# Altium project invernadero (atmega y nano).PrjPcb
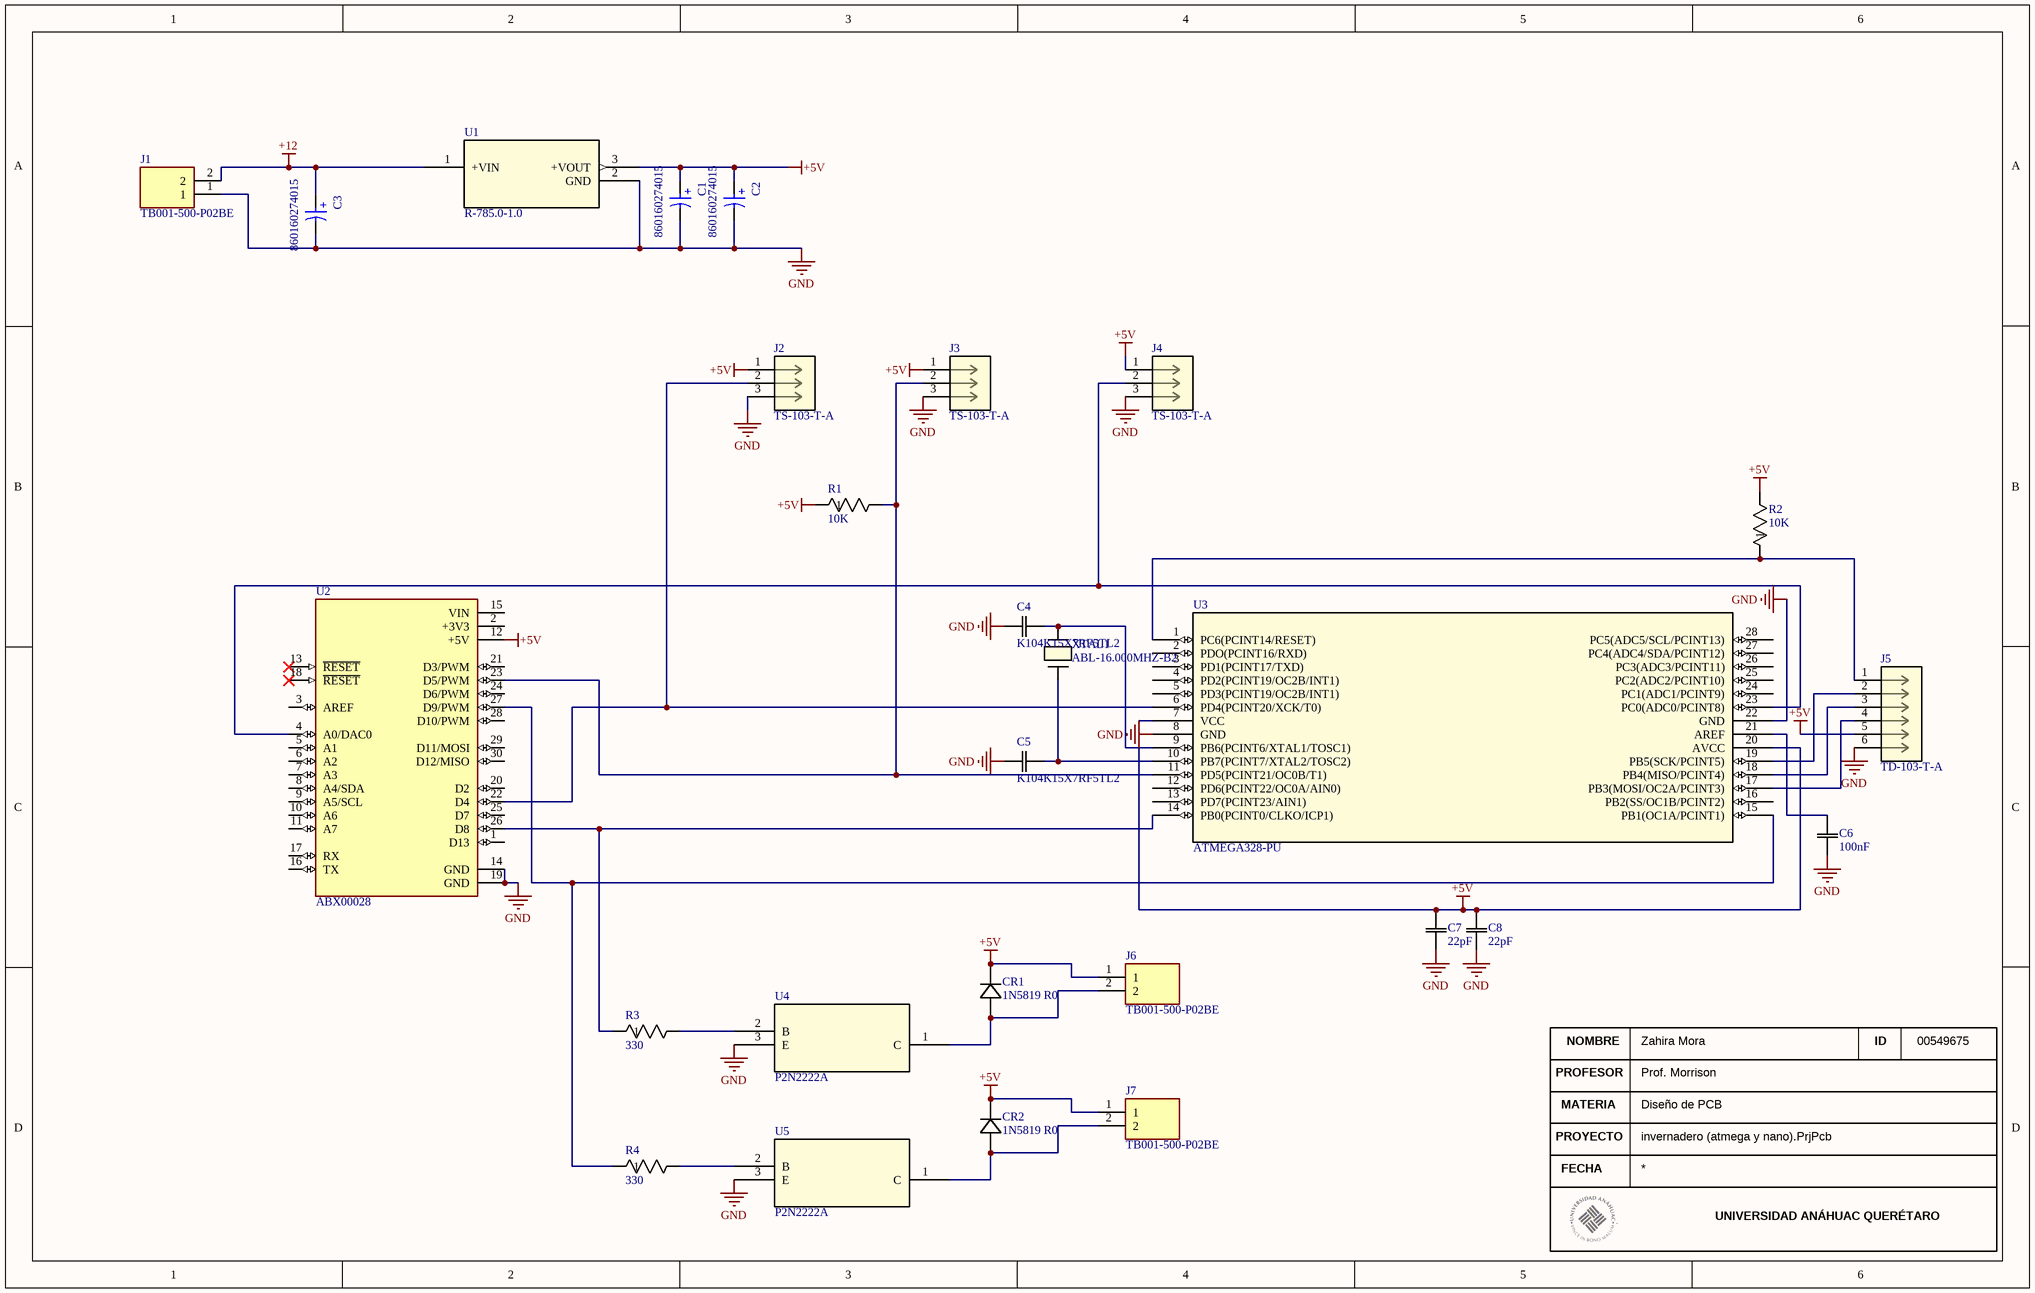
[diagram p0: esquematico.SchDoc]
1 sheet, 27 parts. Net scope: global (net labels, ports and power ports of the same name join across sheets).
Board file: pcb.PcbDoc

## Sheet esquematico.SchDoc
size 381 x 241 mm; ApprovedBy: Prof. Morrison; Author: Zahira Mora; SheetNumber: 1; SheetTotal: 1

### Parts
C1  860160274015  [WCAP-ATLL_D8H11.5]
C2  860160274015  [WCAP-ATLL_D8H11.5]
C3  860160274015  [WCAP-ATLL_D8H11.5]
C4  K104K15X7RF5TL2  [K104K15X7RF5TL2_VIS]
C5  K104K15X7RF5TL2  [K104K15X7RF5TL2_VIS]
C6  100nF  [K104K15X7RF5TL2_VIS]
C7  22pF  [K104K15X7RF5TL2_VIS]
C8  22pF  [K104K15X7RF5TL2_VIS]
CR1  1N5819 R0  [CR_1N5819 R0_TWS]
CR2  1N5819 R0  [CR_1N5819 R0_TWS]
J1  TB001-500-P02BE  [CUI_TB001-500-P02BE]
J2  TS-103-T-A  [CON3_1X3_TU_HTS_SAI]
J3  TS-103-T-A  [CON3_1X3_TU_HTS_SAI]
J4  TS-103-T-A  [CON3_1X3_TU_HTS_SAI]
J5  TD-103-T-A  [CON6_2X3_TU_HTS_SAI]
J6  TB001-500-P02BE  [CUI_TB001-500-P02BE]
J7  TB001-500-P02BE  [CUI_TB001-500-P02BE]
R1  10K  [STA_CF14_STP]
R2  10K  [STA_CF14_STP]
R3  330  [STA_CF14_STP]
R4  330  [STA_CF14_STP]
U1  R-785.0-1.0  [R-785.0-1.0_RCP]
U2  ABX00028  [MODULE_ABX00028]
U3  ATMEGA328-PU  [28P3_SPDIP28_SP_MCH]
U4  P2N2222A  [TO-92-3L_5P33X5P2_ONS]
U5  P2N2222A  [TO-92-3L_5P33X5P2_ONS]
XTAL1  ABL-16.000MHZ-B2  [XTAL_ABL-16_ABR]

### Nets
+5V: C1.1(P) C2.1(P) C7.2 C8.2 CR1.1 CR2.1 J2.1 J3.1 J4.1 J5.5 J6.1 J7.1 R1.1 R2.2 U1.3(+VOUT) U2.12(+5V) U3.7(VCC) U3.20(AVCC)
+12: C3.1(P) J1.2 U1.1(+VIN)
GND: C1.2(N) C2.2(N) C3.2(N) C4.1 C5.1 C6.1 C7.1 C8.1 J1.1 J2.3 J3.3 J4.3 J5.6 U1.2(GND) U2.14(GND) U2.19(GND) U3.8(GND) U3.22(GND) U4.3(E) U5.3(E)
NetC4_2: C4.2 U3.9(PB6(PCINT6/XTAL1/TOSC1)) XTAL1.2
NetC5_2: C5.2 U3.10(PB7(PCINT7/XTAL2/TOSC2)) XTAL1.1
NetC6_2: C6.2 U3.21(AREF)
NetCR1_2: CR1.2 J6.2 U4.1(C)
NetCR2_2: CR2.2 J7.2 U5.1(C)
NetJ2_2: J2.2 U2.22(D4) U3.6(PD4(PCINT20/XCK/T0))
NetJ3_2: J3.2 R1.2 U2.23(D5/PWM) U3.11(PD5(PCINT21/OC0B/T1))
NetJ4_2: J4.2 U2.4(A0/DAC0) U3.23(PC0(ADC0/PCINT8))
NetJ5_1: J5.1 R2.1 U3.1(PC6(PCINT14/RESET))
NetJ5_2: J5.2 U3.19(PB5(SCK/PCINT5))
NetJ5_3: J5.3 U3.18(PB4(MISO/PCINT4))
NetJ5_4: J5.4 U3.17(PB3(MOSI/OC2A/PCINT3))
NetR3_1: R3.1 U2.26(D8) U3.14(PB0(PCINT0/CLKO/ICP1))
NetR3_2: R3.2 U4.2(B)
NetR4_1: R4.1 U2.27(D9/PWM) U3.15(PB1(OC1A/PCINT1))
NetR4_2: R4.2 U5.2(B)

Not connected (* = marked no-connect by the designer): U2 1(D13) 2(+3V3) 3(AREF) 5(A1) 6(A2) 7(A3) 8(A4/SDA) 9(A5/SCL) 10(A6) 11(A7) 13(~{RESET})* 15(VIN) 16(TX) 17(RX) 18(~{RESET})* 20(D2) 21(D3/PWM) 24(D6/PWM) 25(D7) 28(D10/PWM) 29(D11/MOSI) 30(D12/MISO); U3 2(PDO(PCINT16/RXD)) 3(PD1(PCINT17/TXD)) 4(PD2(PCINT19/OC2B/INT1)) 5(PD3(PCINT19/OC2B/INT1)) 12(PD6(PCINT22/OC0A/AIN0)) 13(PD7(PCINT23/AIN1)) 16(PB2(SS/OC1B/PCINT2)) 24(PC1(ADC1/PCINT9)) 25(PC2(ADC2/PCINT10)) 26(PC3(ADC3/PCINT11)) 27(PC4(ADC4/SDA/PCINT12)) 28(PC5(ADC5/SCL/PCINT13))

### Notes on the sheet
- NOMBRE
- ID
- 00549675
- PROFESOR
- MATERIA
- Diseño de PCB
- PROYECTO
- FECHA
- UNIVERSIDAD ANÁHUAC QUERÉTARO
- (in symbol CMP-03913-54007388-2) +

### Library data of the parts
C1 C2 = CMP-03913-54007388-2: 100uF; Leakage Current: 27µA; Polarity: Polar; Voltage Rating: 10V; Ripple Current: 420mA; Pitch: 3.5mm; Impedance: 530mΩ; Life (Hours): 7000hours; Capacitance: 270µF; Tolerance: 20%; Mount: Through Hole; Max Operating Temperature: 105°C; Length: 11.5mm; Lead Pitch: 3.5052mm; Min Operating Temperature: -55°C; Height - Seated (Max): 13.0048mm; Case/Package: Radial; Diameter: 8mm; Packaging: Tape & Box (TB); RoHS: Compliant
C3 = CMP-03913-54007388-2: 47uF; Leakage Current: 27µA; Polarity: Polar; Voltage Rating: 10V; Ripple Current: 420mA; Pitch: 3.5mm; Impedance: 530mΩ; Life (Hours): 7000hours; Capacitance: 270µF; Tolerance: 20%; Mount: Through Hole; Max Operating Temperature: 105°C; Length: 11.5mm; Lead Pitch: 3.5052mm; Min Operating Temperature: -55°C; Height - Seated (Max): 13.0048mm; Case/Package: Radial; Diameter: 8mm; Packaging: Tape & Box (TB); RoHS: Compliant
C4-C6 = K104K15X7RF5TL2: K 50V 100nF Â± 10 % X7R REEL e3; Manufacturer_Name: Vishay; Type: Ceramic Capacitor; Copyright: Copyright (C) 2025 Ultra Librarian. All rights reserved.; Manufacturer_Part_Number: K104K15X7RF5TL2
C7 C8 = K104K15X7RF5TL2: Manufacturer_Name: Vishay; Type: Ceramic Capacitor; Copyright: Copyright (C) 2025 Ultra Librarian. All rights reserved.; Manufacturer_Part_Number: K104K15X7RF5TL2
CR1 CR2 = 1N5819 R0: Description; Manufacturer_Name: Taiwan Semiconductor; Copyright: Copyright (C) 2026 Ultra Librarian. All rights reserved.; Manufacturer_Part_Number: 1N5819 R0
J1 J6 J7 = TB001-500-P02BE: 2~24 Poles, Screw Type, Horizontal, 5.0 Pitch, 22~12 (AWG), Terminal Block Connector; MF: Same Sky; SnapEDA_Link: https://www.snapeda.com/parts/TB001-500-P02BE/Same+Sky/view-part/?ref=snap; Package: None; Value: *; MP: TB001-500-P02BE; Check_prices: https://www.snapeda.com/parts/TB001-500-P02BE/Same+Sky/view-part/?ref=eda
J2-J4 = TS-103-T-A: Description; Manufacturer_Name: Samtec Inc; Copyright: Copyright (C) 2025 Ultra Librarian. All rights reserved.; Manufacturer_Part_Number: TS-103-T-A; RefDes: RefDes; Type: Type
J5 = TD-103-T-A: Description; Manufacturer_Name: Samtec Inc; Copyright: Copyright (C) 2025 Ultra Librarian. All rights reserved.; Manufacturer_Part_Number: TD-103-T-A; RefDes: RefDes; Type: Type
R1 R2 R4 = CF14JT10K0: Description; Manufacturer_Name: Stackpole International; Copyright: Copyright (C) 2025 Ultra Librarian. All rights reserved.; Manufacturer_Part_Number: CF14JT10K0
R3 = CF14JT10K0: Manufacturer_Name: Stackpole International; Copyright: Copyright (C) 2025 Ultra Librarian. All rights reserved.; Manufacturer_Part_Number: CF14JT10K0
U1 = R-785.0-1.0: No Description Available; Manufacturer_Name: Recom Power; Copyright: Copyright (C) 2026 Ultra Librarian. All rights reserved.; Manufacturer_Part_Number: R-785.0-1.0; RefDes: RefDes; Type: Type
U2 = ABX00028: Arduinoâ€™s 5V compatible board in the smallest available form factor: 45x18mm!; MP: Arduino Nano Every; Check_prices: https://www.snapeda.com/parts/Arduino%20Nano%20Every/Arduino/view-part/?ref=eda; Value: *; Availability: Not in stock; Price: None; Package: None; SnapEDA_Link: https://www.snapeda.com/parts/Arduino%20Nano%20Every/Arduino/view-part/?ref=snap; MF: Arduino
U3 = ATMEGA328-PU: Description; Manufacturer_Name: Microchip; Copyright: Copyright (C) 2026 Ultra Librarian. All rights reserved.; Manufacturer_Part_Number: ATMEGA328-PU; RefDes: RefDes; Type: Type
U4 U5 = P2N2222A: Description; Manufacturer_Name: onsemi; Copyright: Copyright (C) 2025 Ultra Librarian. All rights reserved.; Manufacturer_Part_Number: P2N2222A; RefDes: RefDes; Type: Type
XTAL1 = ABL-16.000MHZ-B2: Description; Manufacturer_Name: Abracon; Copyright: Copyright (C) 2026 Ultra Librarian. All rights reserved.; Manufacturer_Part_Number: ABL-16.000MHZ-B2